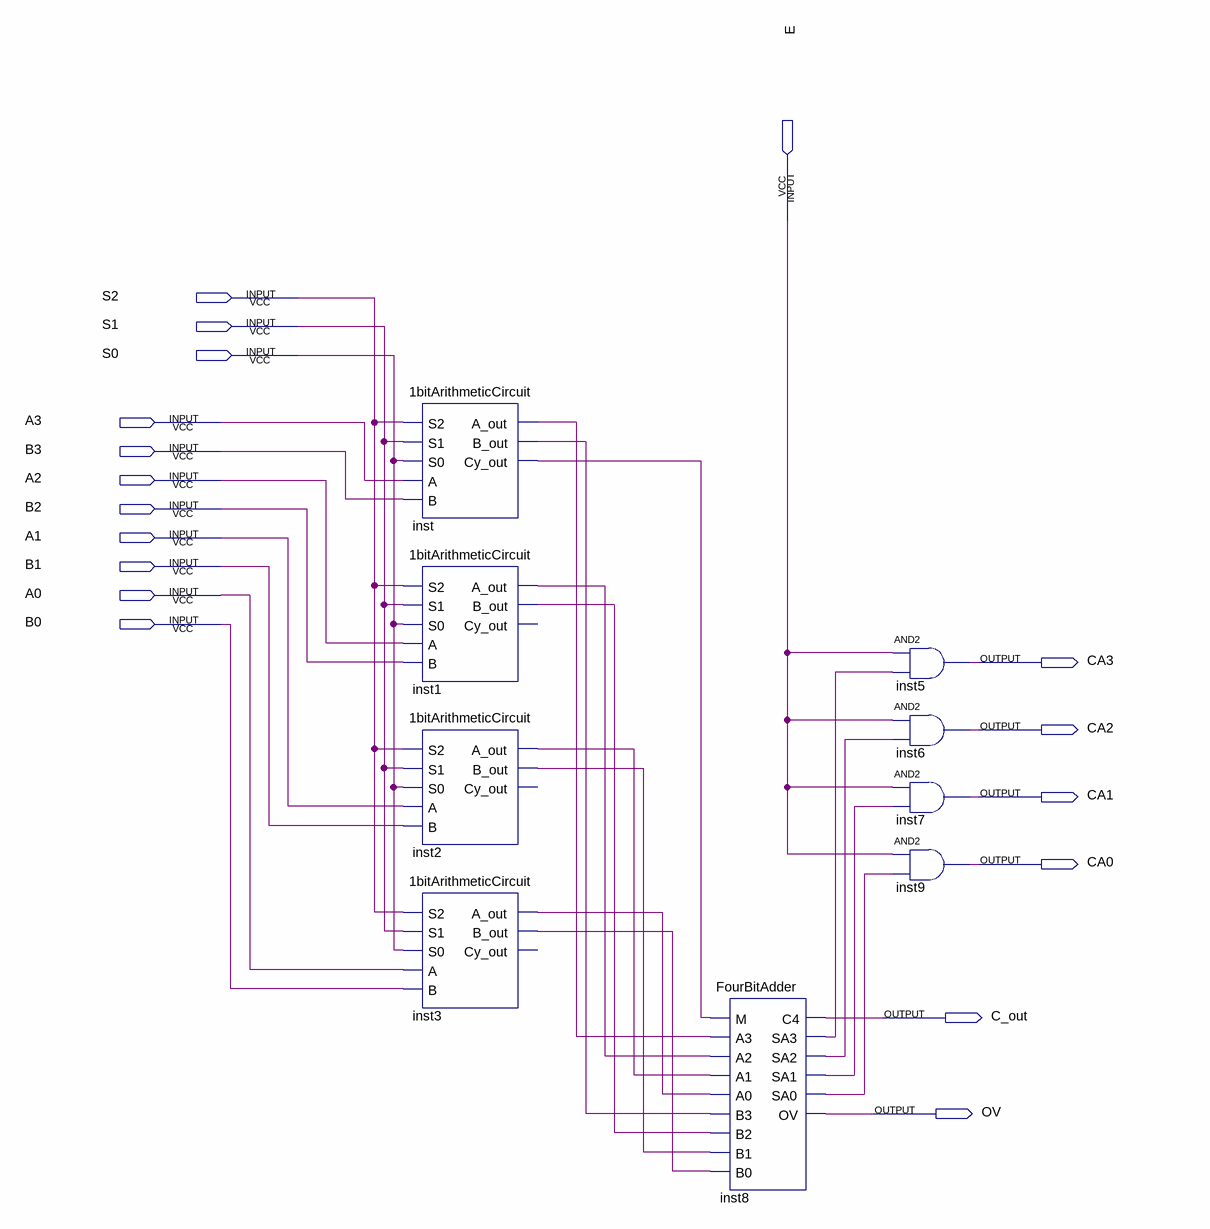
[diagram p0: schematic sheet]
// Quartus schematic 4bitArithmeticCircuit.bdf as structural Verilog: 9 symbols, 18 pins
module \4bitArithmeticCircuit  (
  input  E,
  input  S2,
  input  S1,
  input  S0,
  input  A3,
  input  B3,
  input  A2,
  input  B2,
  input  A1,
  input  B1,
  input  A0,
  input  B0,
  output CA3,
  output CA2,
  output CA1,
  output CA0,
  output C_out,
  output OV
);

  wire inst1_a_out, inst1_b_out, inst2_a_out, inst2_b_out, inst3_a_out, inst3_b_out, inst8_sa0, inst8_sa1,
       inst8_sa2, inst8_sa3, inst_a_out, inst_b_out, inst_cy_out;

  \1bitArithmeticCircuit  inst (
    .S2(S2), .S1(S1), .S0(S0), .A(A3), .B(B3), .A_out(inst_a_out), .B_out(inst_b_out), .Cy_out(inst_cy_out));
  \1bitArithmeticCircuit  inst1 (
    .S2(S2), .S1(S1), .S0(S0), .A(A2), .B(B2), .A_out(inst1_a_out), .B_out(inst1_b_out));  // open: Cy_out
  \1bitArithmeticCircuit  inst2 (
    .S2(S2), .S1(S1), .S0(S0), .A(A1), .B(B1), .A_out(inst2_a_out), .B_out(inst2_b_out));  // open: Cy_out
  \1bitArithmeticCircuit  inst3 (
    .S2(S2), .S1(S1), .S0(S0), .A(A0), .B(B0), .A_out(inst3_a_out), .B_out(inst3_b_out));  // open: Cy_out
  FourBitAdder inst8 (
    .M(inst_cy_out), .A3(inst_a_out), .A2(inst1_a_out), .A1(inst2_a_out), .A0(inst3_a_out), .B3(inst_b_out),
    .B2(inst1_b_out), .B1(inst2_b_out), .B0(inst3_b_out), .C4(C_out), .SA3(inst8_sa3), .SA2(inst8_sa2),
    .SA1(inst8_sa1), .SA0(inst8_sa0), .OV(OV));
  and inst5 (CA3, E, inst8_sa3);
  and inst6 (CA2, E, inst8_sa2);
  and inst7 (CA1, E, inst8_sa1);
  and inst9 (CA0, E, inst8_sa0);
endmodule
